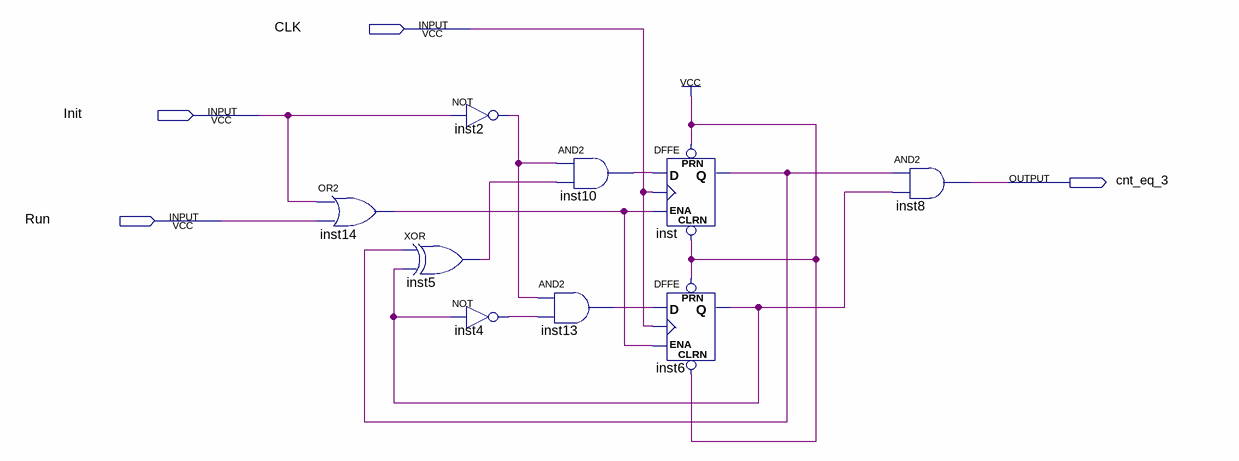
[diagram p0: schematic sheet]
// Quartus schematic cnt_eq_3.bdf as structural Verilog: 9 symbols, 4 pins
module cnt_eq_3 (
  input  CLK,
  input  Init,
  input  Run,
  output cnt_eq_3
);

  wire inst2_out, inst4_out, inst5_out, inst6_q, inst10_out, inst13_out, inst14_out, inst_q;

  or inst14 (inst14_out, Init, Run);
  xor inst5 (inst5_out, inst_q, inst6_q);
  not inst2 (inst2_out, Init);
  not inst4 (inst4_out, inst6_q);
  and inst10 (inst10_out, inst2_out, inst5_out);
  and inst13 (inst13_out, inst2_out, inst4_out);
  DFFE inst (.PRN(1'b1), .CLRN(1'b1), .D(inst10_out), .CLK(CLK), .ENA(inst14_out), .Q(inst_q));
  DFFE inst6 (.PRN(1'b1), .CLRN(1'b1), .D(inst13_out), .CLK(CLK), .ENA(inst14_out), .Q(inst6_q));
  and inst8 (cnt_eq_3, inst_q, inst6_q);
endmodule
